# Altium project Pukk-Display-Module-v1.0.PrjPcb (part 2 of 4)

## Sheet TYPE-C_INTERFACE_SHEET.SchDoc
size A4; SheetNumber: 5; SheetTotal: 10
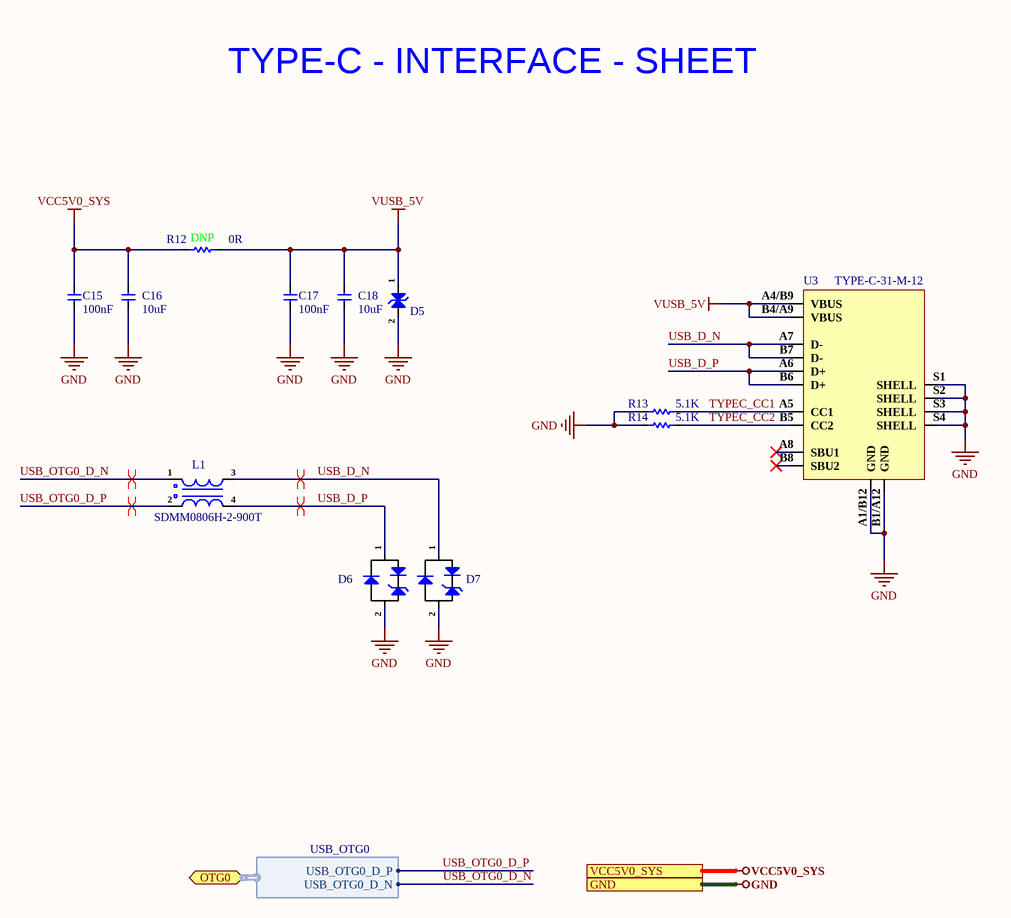
[diagram p4: TYPE-C_INTERFACE_SHEET.SchDoc]

### Parts
C15  100nF  [Cap-0402]
C16  10uF  [Cap-0402]
C17  100nF  [Cap-0402]
C18  10uF  [Cap-0402]
D5  ESD5451N  [DFN1006-2L (Bi-Directional)]  (value not drawn)
D6  ESD5341N-2/TR  [DFN1006-2L_]  (value not drawn)
D7  ESD5341N-2/TR  [DFN1006-2L_]  (value not drawn)
L1  SDMM0806H-2-900T  [0302]
R12  DNP  [Res-0805]
R13  5.1K  [Res-0402]
R14  5.1K  [Res-0402]
U3  TYPE-C-31-M-12  [TYPE-C-31-M-12_]

### Ports
GND (see CAN_SHEET[3D], GPS_INTERFACE_SHEET[3D], HDMI2.0_SHEET[3D], JOYSTICK_BUTTON_SHEET[3D], MIPI_DISPLAY-SHEET[3D], MISCELLANEOUS_SHEET[3D], POWER_SHEET[3C], radxa_CM3J_SHEET-1[4C], radxa_CM3J_SHEET-2[3D]), OTG0 (bidir, harness USB_OTG0, see radxa_CM3J_SHEET-2[1B]), VCC5V0_SYS (see CAN_SHEET[3D], HDMI2.0_SHEET[3D], MIPI_DISPLAY-SHEET[3D], POWER_SHEET[3C], radxa_CM3J_SHEET-1[4C])

### Harnesses
USB_OTG0: USB_OTG0_D_P, USB_OTG0_D_N

### Nets
GND: C15.1 C16.1 C17.1 C18.1 D5.2(K) D6.2(A) D7.2(A) R13.1 R14.1 U3.A1/B12(GND) U3.B1/A12(GND) U3.S1(SHELL) U3.S2(SHELL) U3.S3(SHELL) U3.S4(SHELL) ; port GND
VCC5V0_SYS: C15.2 C16.2 R12.1 ; port VCC5V0_SYS
VUSB_5V: C17.2 C18.2 D5.1(K) R12.2 U3.A4/B9(VBUS) U3.B4/A9(VBUS)
TYPEC_CC1: R13.2 U3.A5(CC1)
TYPEC_CC2: R14.2 U3.B5(CC2)
USB_D_N: D7.1(K) L1.3 U3.A7(D-) U3.B7(D-)
USB_D_P: D6.1(K) L1.4 U3.A6(D+) U3.B6(D+)
USB_OTG0_D_N: L1.1 ; port OTG0.USB_OTG0_D_N
USB_OTG0_D_P: L1.2 ; port OTG0.USB_OTG0_D_P

Not connected (* = marked no-connect by the designer): U3 A8(SBU1)* B8(SBU2)*

### Layout directives
differential pair; differential pair class TYPEC_DP_LINES_90: USB_D_N, USB_D_P, USB_OTG0_D_N, USB_OTG0_D_P

### Notes on the sheet
- TYPE-C - INTERFACE - SHEET
- (near R12) 0R
- File:
- Title:
- Date:
- Page
- Num:
- Total:
- Drawn By: Huzaifa Ali

### Library data of the parts
C15 C17 = CC0402KRX5R7BB104: CAP CER 0.1UF 16V X5R 0402; Manufacturer: Yageo; Tolerance: 10%; Supplier 1: Mouser; Manufacturer Part Number: CC0402KRX5R7BB104; RoHS: Yes; Category: Ceramic Capacitors; Stock 1: 936792; Pricing 1: 1=0.10000, 10=0.02300, 50=0.02300, 100=0.01100, 1000=0.00600, 10000=0.00400 (USD); Mount: Surface Mount; Case/Package: 0402; Number of Pins: 2; Case Code (Metric): 1005; Case Code (Imperial): 0402; Min Operating Temperature: -55°C; Max Operating Temperature: 85°C; Capacitance: 100nF; Dielectric: X5R; Packaging: Tape and Reel; Voltage Rating: 16V; Package Quantity: 1; Voltage Rating (DC): 16V; Termination: SMD/SMT; Resistor Type: Ceramic; Series: CC; Construction: Flat; Length: 1mm; Width: 0.02inch; Height: 0.5mm; Thickness: 0.022inch; Depth: 0.5mm; Radiation Hardening: No; REACH SVHC: Unknown; Lead Free: Lead Free; Halogen Free: Halogen Free; RoHS Compliant: Yes; ComponentLink1URL: https://datasheet.ciiva.com/155/mlccorderingcode-155879.pdf?src-supplier=Digi-Key; ComponentLink1Description: https://datasheet.ciiva.com/155/mlccorderingcode-155879.pdf?src-supplier=Digi-Key; ComponentLink2URL: https://datasheet.ciiva.com/155/mlccorderingcode-155878.pdf?src-supplier=Digi-Key; ComponentLink2Description: https://datasheet.ciiva.com/155/mlccorderingcode-155878.pdf?src-supplier=Digi-Key; ComponentLink3URL: https://datasheet.ciiva.com/155/mlccorderingcode-155880.pdf?src-supplier=Digi-Key; ComponentLink3Description: https://datasheet.ciiva.com/155/mlccorderingcode-155880.pdf?src-supplier=Digi-Key; ComponentLink4URL: https://datasheet.ciiva.com/11464/upy-gphc-x5r-4v-to-50v-12-11464869.pdf?src-supplier=Avnet; ComponentLink4Description: https://datasheet.ciiva.com/11464/upy-gphc-x5r-4v-to-50v-12-11464869.pdf?src-supplier=Avnet; Supplier Part Number 1: 603-CC402KRX5R7BB104; LCSC Part Number: C106204
C16 C18 = CC0402MRX5R6BB106: CAP CER 10UF 10V X5R 0402; Manufacturer: Yageo; Item Type: Capacitor; Tolerance: 20%; Manufacturer Part Number: CC0402MRX5R6BB106; ComponentLink1URL: http://www.yageo.com/documents/recent/UPY-GPHC_X5R_4V-to-50V_25.pdf?src-supplier=Digi-Key; ComponentLink1Description: http://www.yageo.com/documents/recent/UPY-GPHC_X5R_4V-to-50V_25.pdf?src-supplier=Digi-Key; LCSC Part Number: C962143; Supplier 1: Future Electronics; RoHS: Yes; Category: Ceramic Capacitors; Stock 1: 80000; Pricing 1: 10000=0.02650, 20000=0.02590, 30000=0.02550, 40000=0.02530, 50000=0.02450 (USD); Mount: Surface Mount; Case/Package: 0402; Case Code (Imperial): 0402; Case Code (Metric): 1005; Min Operating Temperature: -55°C; Max Operating Temperature: 85°C; Packaging: Tape and Reel; Capacitance: 10uF; Voltage Rating: 10V; RoHS Compliant: Yes; Supplier Part Number 1: 6097631
D5 = ESD5451N: DFN1006-2(0402) ESD Protection Devices ROHS; Manufacturer: TECH PUBLIC; Manufacturer Part Number: ESD5451N; Footprint: DFN1006-2(0402); ComponentLink1Description: LCSC; ComponentLink1URL: https://www.lcsc.com/product-detail/span-style-background-color-ff0-ESD-span-Protection-Devices_TECH-PUBLIC-ESD5451N_C2936977.html; LCSC Part Number: C2936977
D6 D7 = ESD5341N-2/TR: 4A@8/20us 15V 7V 5V Unidirectional DFN1006-2L TVS ROHS; Manufacturer: WILLSEMI; Item Type: Diode; Manufacturer Part Number: ESD5341N-2/TR; Package: DFN1006-2L; ComponentLink1Description: LCSC; ComponentLink1URL: https://www.lcsc.com/product-detail/TVS_WILLSEMI-Will-Semicon-ESD5341N-2-TR_C239773.html; LCSC Part Number: C239773
L1 = SDMM0806H-2-900T: 90Ω@100MHz 4Ω 2 0302 Common Mode Filters ROHS; Manufacturer: Sunlord; Manufacturer Part Number: SDMM0806H-2-900T; Package: 0302; LCSC Part Number: C370285; Item Type: Common Mode Filter; ComponentLink1Description: LCSC; ComponentLink1URL: https://www.lcsc.com/product-detail/Common-Mode-Filters_Sunlord-SDMM0806H-2-900T_C370285.html
R12 = RC0805FR-070RL: RES 0 OHM JUMPER 1/8W 0805; Manufacturer: Yageo; Resistance: 0mR; Tolerance: 1%; Power Rating: 125mW; Item Type: Resistor; Supplier 1: Avnet; Manufacturer Part Number: RC0805FR-070RL; RoHS: Yes; Category: Chip SMD Resistors; Stock 1: 85000; Pricing 1: 5000=0.00281, 10000=0.00277, 20000=0.00269 (USD); Case/Package: 0805; Contact Plating: Tin,Matte; Case Code (Imperial): 0805; Case Code (Metric): 2012; Size Code: 0805; Min Operating Temperature: -55°C; Max Operating Temperature: 155°C; Resistor Type: Thick Film; Packaging: Tape and Reel; Features: Moisture Resistant; Series: RC; Max Power Dissipation: 125mW; Number of Terminations: 2; Construction: Rectangular; Length: 2mm; Depth: 1.25mm; Radiation Hardening: No; Military Standard: Not; Lead Free: Lead Free; RoHS Compliant: Yes; ComponentLink1URL: https://datasheet.ciiva.com/15189/getdatasheetpartid-348154-15189885.pdf?src-supplier=Verical; ComponentLink1Description: https://datasheet.ciiva.com/15189/getdatasheetpartid-348154-15189885.pdf?src-supplier=Verical; ComponentLink2URL: https://datasheet.ciiva.com/17042/rc0805-17042698.pdf?src-supplier=Future+Electronics; ComponentLink2Description: https://datasheet.ciiva.com/17042/rc0805-17042698.pdf?src-supplier=Future+Electronics; Supplier Part Number 1: RC0805FR-070RL; LCSC Part Number: C100045
R13 R14 = RC0402FR-075K1L: RES 5.1K OHM 1% 1/16W 0402; Manufacturer: Yageo; Power Rating: 63mW; Resistance: 5.1kR; Temperature Coefficient: 100ppm/°C; Voltage Rating: 50V; Item Type: Resistor; Supplier 1: Avnet; Manufacturer Part Number: RC0402FR-075K1L; RoHS: Yes; Category: Chip SMD Resistors; Stock 1: 65000; Pricing 1: 10000=0.00085 (USD); Case/Package: 0402; Case Code (Metric): 1005; Case Code (Imperial): 0402; Min Operating Temperature: -55°C; Max Operating Temperature: 155°C; Tolerance: 1%; Technology: THICK FILM; Packaging: Tape and Reel; Package Quantity: 1; Resistor Type: Thick Film; Number of Terminations: 2; Termination: SMD/SMT; Max Power Dissipation: 63mW; Voltage Rating (DC): 50V; Working Voltage: 50V; Features: Moisture Resistant; Series: RC; Resistance Tolerance: 1%; Construction: Rectangular; Length: 1mm; Width: 0.02inch; Height: 0.016inch; Depth: 0.5mm; RoHS Compliant: Yes; Military Standard: Not; Lead Free: Lead Free; ComponentLink1URL: https://datasheet.ciiva.com/7983/1018594-7983519.pdf?src-supplier=Element14; ComponentLink1Description: https://datasheet.ciiva.com/7983/1018594-7983519.pdf?src-supplier=Element14; ComponentLink2URL: https://datasheet.ciiva.com/46394/1018594-46394936.pdf?src-supplier=Element14; ComponentLink2Description: https://datasheet.ciiva.com/46394/1018594-46394936.pdf?src-supplier=Element14; ComponentLink3URL: https://datasheet.ciiva.com/2453/pyu-r-int-thick-7-2453401.pdf?src-supplier=Digi-Key; ComponentLink3Description: https://datasheet.ciiva.com/2453/pyu-r-int-thick-7-2453401.pdf?src-supplier=Digi-Key; ComponentLink4URL: https://datasheet.ciiva.com/2453/pyu-r-int-thick-7-2453402.pdf?src-supplier=Digi-Key; ComponentLink4Description: https://datasheet.ciiva.com/2453/pyu-r-int-thick-7-2453402.pdf?src-supplier=Digi-Key; ComponentLink5URL: https://datasheet.ciiva.com/2453/pyu-r-int-thick-7-2453400.pdf?src-supplier=Digi-Key; ComponentLink5Description: https://datasheet.ciiva.com/2453/pyu-r-int-thick-7-2453400.pdf?src-supplier=Digi-Key; ComponentLink6URL: https://datasheet.ciiva.com/12558/pyu-rc0402-51-rohs-l-6-r-8721-12558460.pdf?src-supplier=Mouser; ComponentLink6Description: https://datasheet.ciiva.com/12558/pyu-rc0402-51-rohs-l-6-r-8721-12558460.pdf?src-supplier=Mouser; ComponentLink7URL: https://datasheet.ciiva.com/16744/pyu-rc0402-51-rohs-l-6-r-16744283.pdf?src-supplier=Future+Electronics; ComponentLink7Description: https://datasheet.ciiva.com/16744/pyu-rc0402-51-rohs-l-6-r-16744283.pdf?src-supplier=Future+Electronics; ComponentLink8URL: https://datasheet.ciiva.com/15189/getdatasheetpartid-323636-15189493.pdf?src-supplier=Verical; ComponentLink8Description: https://datasheet.ciiva.com/15189/getdatasheetpartid-323636-15189493.pdf?src-supplier=Verical; Supplier Part Number 1: RC0402FR-075K1L; LCSC Part Number: C105872
U3 = TYPE-C-31-M-12: 5A 1 16P Female Type-C SMD USB Connectors ROHS; Manufacturer: Korean Hroparts Elec; ComponentLink1Description: LCSC; ComponentLink1URL: https://www.lcsc.com/product-detail/USB-Connectors_Korean-Hroparts-Elec-TYPE-C-31-M-12_C165948.html; Manufacturer Part Number: TYPE-C-31-M-12; Footprint: Custom; LCSC Part Number: C165948; Item Type: USB Connector

## Sheet MIPI_DISPLAY-SHEET.SchDoc
size A4; SheetNumber: 6; SheetTotal: 10
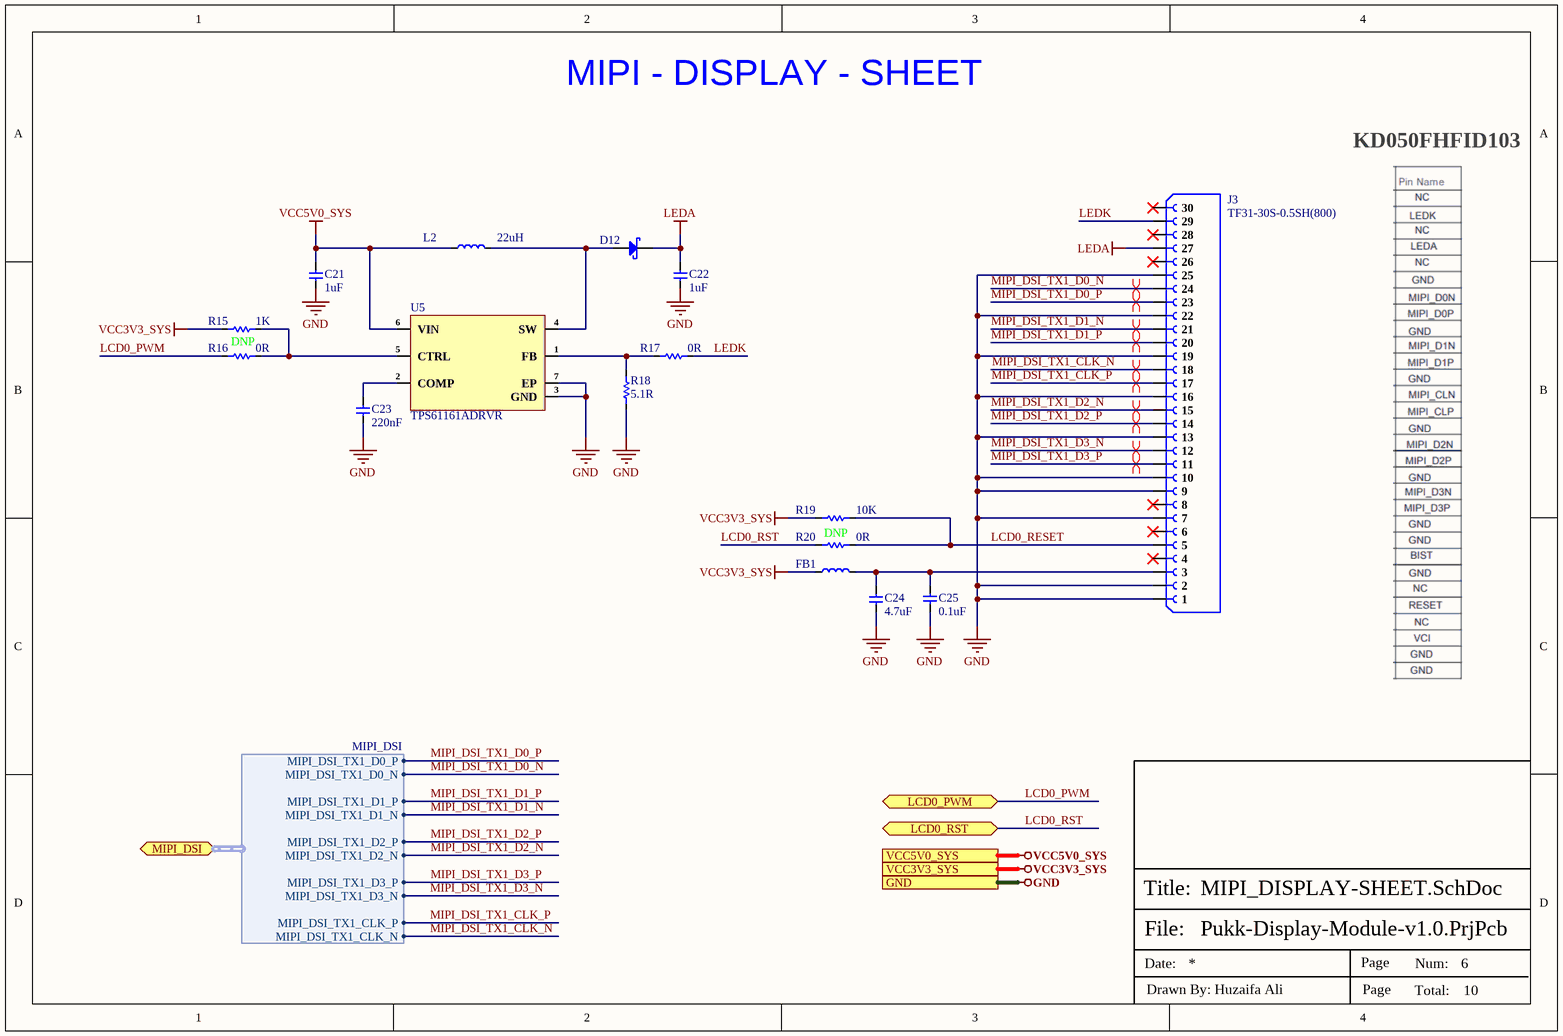
[diagram p5: MIPI_DISPLAY-SHEET.SchDoc]

### Parts
C21  1uF  [Cap-0603]
C22  1uF  [Cap-0603]
C23  220nF  [Cap-0402]
C24  4.7uF  [Cap-0402]
C25  0.1uF  [Cap-0402]
D12  SS16  [SMA]  (value not drawn)
FB1  BLM18PG181SN1D  [IND-0603 (1608 Metric)]  (value not drawn)
J3  TF31-30S-0.5SH(800)  [TF31-30S-0.5SH(800)]
L2  22uH  [VLCF5020T-220MR75-1]
R15  1K  [Res-0402]
R16  DNP  [Res-0402]
R17  0R  [Res-0402]
R18  5.1R  [RES-0805]
R19  10K  [Res-0402]
R20  DNP  [Res-0402]
U5  TPS61161ADRVR  [WSON-6-EP(2x2)]

### Ports
GND (see CAN_SHEET[3D], GPS_INTERFACE_SHEET[3D], HDMI2.0_SHEET[3D], JOYSTICK_BUTTON_SHEET[3D], MISCELLANEOUS_SHEET[3D], POWER_SHEET[3C], radxa_CM3J_SHEET-1[4C], radxa_CM3J_SHEET-2[3D], TYPE-C_INTERFACE_SHEET[3D]), LCD0_PWM (bidir, see radxa_CM3J_SHEET-1[4C]), LCD0_RST (bidir, see radxa_CM3J_SHEET-1[4C]), MIPI_DSI (bidir, harness MIPI_DSI, see radxa_CM3J_SHEET-2[1D]), VCC3V3_SYS (see GPS_INTERFACE_SHEET[3D], HDMI2.0_SHEET[3D], MISCELLANEOUS_SHEET[3D], POWER_SHEET[3C]), VCC5V0_SYS (see CAN_SHEET[3D], HDMI2.0_SHEET[3D], POWER_SHEET[3C], radxa_CM3J_SHEET-1[4C], TYPE-C_INTERFACE_SHEET[3D])

### Harnesses
MIPI_DSI: MIPI_DSI_TX1_D0_P, MIPI_DSI_TX1_D0_N, MIPI_DSI_TX1_D1_P, MIPI_DSI_TX1_D1_N, MIPI_DSI_TX1_D2_P, MIPI_DSI_TX1_D2_N, MIPI_DSI_TX1_D3_P, MIPI_DSI_TX1_D3_N, MIPI_DSI_TX1_CLK_P, MIPI_DSI_TX1_CLK_N

### Nets
GND: C21.1 C22.1 C23.1 C24.1 C25.2 J3.1 J3.2 J3.7 J3.9 J3.10 J3.13 J3.16 J3.19 J3.22 J3.25 R18.1 U5.3(GND) U5.7(EP) ; port GND
LEDA: C22.2 D12.1(K) J3.27
VCC3V3_SYS: FB1.1 R15.2 R19.2 ; port VCC3V3_SYS
VCC5V0_SYS: C21.2 L2.1 U5.6(VIN) ; port VCC5V0_SYS
LCD0_PWM: R16.1 ; port LCD0_PWM
LCD0_RESET: J3.5 R19.1 R20.2
LCD0_RST: R20.1 ; port LCD0_RST
LEDK: J3.29 R17.2
MIPI_DSI_TX1_CLK_N: J3.18 ; port MIPI_DSI.MIPI_DSI_TX1_CLK_N
MIPI_DSI_TX1_CLK_P: J3.17 ; port MIPI_DSI.MIPI_DSI_TX1_CLK_P
MIPI_DSI_TX1_D0_N: J3.24 ; port MIPI_DSI.MIPI_DSI_TX1_D0_N
MIPI_DSI_TX1_D0_P: J3.23 ; port MIPI_DSI.MIPI_DSI_TX1_D0_P
MIPI_DSI_TX1_D1_N: J3.21 ; port MIPI_DSI.MIPI_DSI_TX1_D1_N
MIPI_DSI_TX1_D1_P: J3.20 ; port MIPI_DSI.MIPI_DSI_TX1_D1_P
MIPI_DSI_TX1_D2_N: J3.15 ; port MIPI_DSI.MIPI_DSI_TX1_D2_N
MIPI_DSI_TX1_D2_P: J3.14 ; port MIPI_DSI.MIPI_DSI_TX1_D2_P
MIPI_DSI_TX1_D3_N: J3.12 ; port MIPI_DSI.MIPI_DSI_TX1_D3_N
MIPI_DSI_TX1_D3_P: J3.11 ; port MIPI_DSI.MIPI_DSI_TX1_D3_P
NetC23_2: C23.2 U5.2(COMP)
NetC24_2: C24.2 C25.1 FB1.2 J3.3
NetD12_2: D12.2(A) L2.2 U5.4(SW)
NetR15_1: R15.1 R16.2 U5.5(CTRL)
NetR17_1: R17.1 R18.2 U5.1(FB)

Not connected (* = marked no-connect by the designer): J3 4* 6* 8* 26* 28* 30*

### Layout directives
differential pair; differential pair class MIPI; rule Impedance Constraint [Min = 97.00    Max = 103.0    ]: MIPI_DSI_TX1_CLK_N, MIPI_DSI_TX1_CLK_P, MIPI_DSI_TX1_D0_N, MIPI_DSI_TX1_D0_P, MIPI_DSI_TX1_D1_N, MIPI_DSI_TX1_D1_P, MIPI_DSI_TX1_D2_N, MIPI_DSI_TX1_D2_P, MIPI_DSI_TX1_D3_N, MIPI_DSI_TX1_D3_P

### Notes on the sheet
- MIPI - DISPLAY - SHEET
- KD050FHFID103
- (near R16) 0R
- (near R20) 0R
- File:
- Title:
- Date:
- Page
- Num:
- Total:
- Drawn By: Huzaifa Ali

### Library data of the parts
C21 C22 = CL10A105KB8NNNC: CAP CER 1UF 50V X5R 0603; Manufacturer: Samsung; Material: 4241ConductorMaterial; Tolerance: 10%; Item Type: Capacitor; Supplier: Avnet; Supplier Part Number: CL10A105KB8NNNC; Manufacturer Part Number: CL10A105KB8NNNC; RoHS: Yes; Category: Ceramic Capacitors; Stock: 780446; Pricing: 4000=0.01632, 8000=0.01595, 16000=0.01557, 24000=0.0152, 32000=0.01482 (USD); Mounting Technology: Surface Mount; Case/Package: 0603; Case Code (Metric): 1608; Case Code (Imperial): 0603; Min Operating Temperature: -55°C; Max Operating Temperature: 85°C; Packaging: Tape and Reel; Value: 1uF; Voltage Rating: 50V; Dielectric: X5R; Series: CL; Voltage Rating (DC): 50V; Length: 1.6mm; Depth: 0.8mm; Radiation Hardening: No; RoHS Compliant: Yes; ComponentLink1URL: https://datasheet.ciiva.com/26877/getdatasheetpartid-753736-26877879.pdf?src-supplier=Verical; ComponentLink1Description: https://datasheet.ciiva.com/26877/getdatasheetpartid-753736-26877879.pdf?src-supplier=Verical; LCSC Part Number: C15849
C23 = CC0402KRX5R8BB224: CAP CER 0.22UF 25V X5R 0402; Manufacturer: Yageo; Item Type: Capacitors; Tolerance: 10%; Supplier 1: Mouser; Manufacturer Part Number: CC0402KRX5R8BB224; RoHS: Yes; Stock 1: 61266; Pricing 1: 1=0.10000, 10=0.03300, 50=0.03300, 100=0.02700, 1000=0.01500, 10000=0.01300 (USD); Mount: Surface Mount; Case/Package: 0402; Min Operating Temperature: -55°C; Max Operating Temperature: 85°C; Packaging: Tape and Reel; Capacitance: 220nF; Voltage Rating: 25V; Voltage Rating (DC): 25V; Dielectric: X5R; Length: 0.039inch; Width: 0.02inch; Thickness: 0.022inch; Lead Free: Lead Free; Halogen Free: Halogen Free; RoHS Compliant: Yes; ComponentLink1URL: http://www.yageo.com/documents/recent/UPY-GPHC_X5R_4V-to-50V_25.pdf?src-supplier=Digi-Key; ComponentLink1Description: http://www.yageo.com/documents/recent/UPY-GPHC_X5R_4V-to-50V_25.pdf?src-supplier=Digi-Key; ComponentLink2URL: https://www.yageo.com/upload/media/product/productsearch/datasheet/mlcc/UPY-GPHC_X5R_4V-to-50V_26.pdf?src-supplier=Digi-Key; ComponentLink2Description: https://www.yageo.com/upload/media/product/productsearch/datasheet/mlcc/UPY-GPHC_X5R_4V-to-50V_26.pdf?src-supplier=Digi-Key; ComponentLink3URL: http://www.yageo.com/documents/recent/UPY-GPHC_X5R_4V-to-50V_23.pdf?src-supplier=Digi-Key; ComponentLink3Description: http://www.yageo.com/documents/recent/UPY-GPHC_X5R_4V-to-50V_23.pdf?src-supplier=Digi-Key; Supplier Part Number 1: 603-CC402KRX5R8BB224; LCSC Part Number: C326836
C24 = CC0402KRX5R6BB475: CAP CER 4.7UF 10V X5R 0402; Manufacturer: Yageo; Tolerance: 10%; Supplier 1: Farnell; Manufacturer Part Number: CC0402KRX5R6BB475; RoHS: Yes; Category: Ceramic Capacitors; Stock 1: 20000; Pricing 1: 10000=0.02310, 50000=0.02100 (GBP); Mount: Surface Mount; Case/Package: 0402; Case Code (Imperial): 0402; Case Code (Metric): 1005; Min Operating Temperature: -55°C; Max Operating Temperature: 85°C; Packaging: Cut Tape; Capacitance: 4.7uF; Voltage Rating: 10V; RoHS Compliant: Yes; ComponentLink1URL: http://www.yageo.com/documents/recent/UPY-GPHC_X5R_4V-to-50V_25.pdf?src-supplier=Digi-Key; ComponentLink1Description: http://www.yageo.com/documents/recent/UPY-GPHC_X5R_4V-to-50V_25.pdf?src-supplier=Digi-Key; Supplier Part Number 1: 3871698; LCSC Part Number: C326586
C25 = GRM155R71H104ME14D: CAP CER 0.1UF 50V X7R 0402; Manufacturer: Murata; Tolerance: 20%; Capacitance: 100nF; Item Type: Capacitor; Supplier 1: Avnet; Manufacturer Part Number: GRM155R71H104ME14D; RoHS: Yes; Category: Ceramic Capacitors; Stock 1: 100000; Pricing 1: 10000=0.00444, 20000=0.00420, 40000=0.00396, 60000=0.00372, 80000=0.00348, 100000=0.00324, 1000000=0.00300 (USD); Mount: Surface Mount; Case/Package: 0402; Min Operating Temperature: -55°C; Max Operating Temperature: 125°C; Packaging: Cut Tape; Voltage Rating: 50V; Length: 0.039inch; Width: 0.02inch; Thickness: 0.022inch; RoHS Compliant: Yes; ComponentLink1URL: http://www.mouser.com/ds/2/281/c02e-2905.pdf?src-supplier=Mouser; ComponentLink1Description: http://www.mouser.com/ds/2/281/c02e-2905.pdf?src-supplier=Mouser; ComponentLink2URL: http://search.murata.co.jp/Ceramy/image/img/A01X/G101/ENG/GRM155R71H104ME14-01.pdf?src-supplier=Digi-Key; ComponentLink2Description: http://search.murata.co.jp/Ceramy/image/img/A01X/G101/ENG/GRM155R71H104ME14-01.pdf?src-supplier=Digi-Key; ComponentLink3URL: http://psearch.en.murata.com/capacitor/product/GRM155R71H104ME14%23.pdf?src-supplier=Avnet; ComponentLink3Description: http://psearch.en.murata.com/capacitor/product/GRM155R71H104ME14%23.pdf?src-supplier=Avnet; Supplier Part Number 1: GRM155R71H104ME14D; LCSC Part Number: C182412
D12 = SS16: 60V 700mV@1A 1A SMA(DO-214AC) Schottky Barrier Diodes (SBD) ROHS; Manufacturer: MDD; Item Type: Schottky Diode; Manufacturer Part Number: SS16; Package: SMA(DO-214AC); LCSC Part Number: C2481; ComponentLink1Description: LCSC; ComponentLink1URL: https://www.lcsc.com/product-detail/Schottky-Barrier-Diodes-SBD_MDD-Microdiode-Electronics-SS16_C2481.html
FB1 = BLM18PG181SN1D: 0603 180Ω ±25% DCR=0.09Ω 1.5A; Manufacturer: Murata; Manufacturer Series: BLM18P; Core Material: Ferrite; Material: Ferrite,Steel; Impedance: 180R; Number of Lines: 1; DC Resistance (DCR): 90mR; Test Frequency: 100MHz; Shielding: Unshielded; Item Type: Ferrite Bead; Supplier 1: Arrow Electronics; Manufacturer Part Number: BLM18PG181SN1D; RoHS: Yes; Category: Inductors; Stock 1: 13; Pricing 1: 1=0.08740, 10=0.06280 (USD); Case/Package: 0603; Number of Pins: 2; Case Code (Metric): 1608; Case Code (Imperial): 0603; Terminal Finish: Tin; Min Operating Temperature: -55°C; Max Operating Temperature: 125°C; Package Quantity: 1; Tolerance: 25%; Packaging: Tape and Reel; Current Rating: 1.5A; Max Current Rating: 1.5A; Max DC Current: 1.5A; Termination: SMD/SMT; DC Current: 1.5A; Number of Circuits: 1; Series: BLM18P; Number of Functions: 1; DC Resistance-Max: 90mR; Length: 1.6mm; Width: 0.8mm; Height: 0.8mm; Depth: 0.8mm; Radiation Hardening: No; REACH SVHC: No SVHC; Lead Free: Lead Free; RoHS Compliant: Yes; ComponentLink1URL: https://datasheet.ciiva.com/36526/1845021-36526048.pdf?src-supplier=Jameco; ComponentLink1Description: https://datasheet.ciiva.com/36526/1845021-36526048.pdf?src-supplier=Jameco; ComponentLink2URL: https://datasheet.ciiva.com/11800/0900766b81275ca5-11800854.pdf?src-supplier=RSComponents; ComponentLink2Description: https://datasheet.ciiva.com/11800/0900766b81275ca5-11800854.pdf?src-supplier=RSComponents; ComponentLink3URL: https://datasheet.ciiva.com/29347/442378-da-01-en-chip-drossel-0603-180r-1500ma-1-6x0-8mm-29347913.pdf?src-supplier=Conrad; ComponentLink3Description: https://datasheet.ciiva.com/29347/442378-da-01-en-chip-drossel-0603-180r-1500ma-1-6x0-8mm-29347913.pdf?src-supplier=Conrad; ComponentLink4URL: https://datasheet.ciiva.com/8021/5148-8021478.pdf?src-supplier=Element14; ComponentLink4Description: https://datasheet.ciiva.com/8021/5148-8021478.pdf?src-supplier=Element14; ComponentLink5URL: https://datasheet.ciiva.com/8021/5148-8021496.pdf?src-supplier=Element14; ComponentLink5Description: https://datasheet.ciiva.com/8021/5148-8021496.pdf?src-supplier=Element14; ComponentLink6URL: https://datasheet.ciiva.com/1012/l0110s0100blm18p-1012153.pdf?src-supplier=Digi-Key; ComponentLink6Description: https://datasheet.ciiva.com/1012/l0110s0100blm18p-1012153.pdf?src-supplier=Digi-Key; ComponentLink7URL: https://datasheet.ciiva.com/1012/l0110s0100blm18p-1012152.pdf?src-supplier=Digi-Key; ComponentLink7Description: https://datasheet.ciiva.com/1012/l0110s0100blm18p-1012152.pdf?src-supplier=Digi-Key; ComponentLink8URL: https://datasheet.ciiva.com/1012/l0110s0100blm18p-1012154.pdf?src-supplier=Digi-Key; ComponentLink8Description: https://datasheet.ciiva.com/1012/l0110s0100blm18p-1012154.pdf?src-supplier=Digi-Key; ComponentLink9URL: https://datasheet.ciiva.com/8084/l0110s0100blm18p-8084296.pdf?src-supplier=Avnet; ComponentLink9Description: https://datasheet.ciiva.com/8084/l0110s0100blm18p-8084296.pdf?src-supplier=Avnet; ComponentLink10URL: https://datasheet.ciiva.com/16394/l0110s0100blm18p-16394029.pdf?src-supplier=Future+Electronics; ComponentLink10Description: https://datasheet.ciiva.com/16394/l0110s0100blm18p-16394029.pdf?src-supplier=Future+Electronics; Supplier Part Number 1: BLM18PG181SN1D; LCSC Part Number: C82850
J3 = TF31-30S-0.5SH(800): CONN FFC BOTTOM 30POS 0.5MM R/A; Manufacturer: Hirose; Item Type: FFC / FPC Connector; Supplier: Digikey; Supplier Part Number: 26-TF31-30S-0.5SH(800)CT-ND; Manufacturer Part Number: TF31-30S-0.5SH(800); RoHS: Yes; Stock: 14095; Pricing: 1=2.37, 10=2.065, 25=1.9772, 50=1.9332, 100=1.8453, 250=1.66952, 500=1.53772, 1000=1.31805 (USD); ComponentLink1URL: https://www.hirose.com/product/download/?distributor=digikey&amp;type=specSheet&amp;lang=en&amp;num=TF31-30S-0.5SH(800)&src-supplier=Digikey; ComponentLink1Description: https://www.hirose.com/product/download/?distributor=digikey&amp;type=specSheet&amp;lang=en&amp;num=TF31-30S-0.5SH(800)&src-supplier=Digikey; ComponentLink2URL: https://datasheet.octopart.com/TF31-30S-0.5SH%28800%29-Hirose-datasheet-138123803.pdf?src-supplier=Sager+Electronics; ComponentLink2Description: https://datasheet.octopart.com/TF31-30S-0.5SH%28800%29-Hirose-datasheet-138123803.pdf?src-supplier=Sager+Electronics; LCSC Part Number: C5137133
L2 = VLCF5020T-220MR75-1: FIXED IND 22UH 750MA 496MOHM SMD; Manufacturer: TDK; Item Type: Inductors; Supplier: Avnet; LCSC Part Number: C87576; Manufacturer Part Number: VLCF5020T-220MR75-1; RoHS: Yes; Stock: 1000; Pricing: 500=0.2562 (USD); ComponentLink1URL: https://datasheet.ciiva.com/11800/0900766b807a173e-11800091.pdf?src-supplier=Rs; ComponentLink1Description: https://datasheet.ciiva.com/11800/0900766b807a173e-11800091.pdf?src-supplier=Rs; ComponentLink2URL: https://datasheet.ciiva.com/4956/e531-vlcf-18500-4956649.pdf?src-supplier=Mouser; ComponentLink2Description: https://datasheet.ciiva.com/4956/e531-vlcf-18500-4956649.pdf?src-supplier=Mouser; ComponentLink3URL: https://datasheet.ciiva.com/8045/516785-8045801.pdf?src-supplier=Element14; ComponentLink3Description: https://datasheet.ciiva.com/8045/516785-8045801.pdf?src-supplier=Element14; ComponentLink4URL: https://datasheet.ciiva.com/22725/516785-22725947.pdf?src-supplier=Element14; ComponentLink4Description: https://datasheet.ciiva.com/22725/516785-22725947.pdf?src-supplier=Element14
R15 = RC0402FR-071KL: RES 1K OHM 1% 1/16W 0402; Manufacturer: Yageo; Resistance: 1kR; Temperature Coefficient: 100ppm/°C; Voltage Rating (DC): 50V; Power Rating: 62.5mW; Max Power Dissipation: 63mW; Item Type: Resistor; Supplier 1: Avnet; Manufacturer Part Number: RC0402FR-071KL; RoHS: Yes; Category: Chip SMD Resistors; Stock 1: 13030000; Pricing 1: 10000=0.00085, 20000=0.00087, 40000=0.00084, 60000=0.00083, 80000=0.00079, 100000=0.00078, 1000000=0.00076 (USD); Case/Package: 0402; Number of Pins: 2; Case Code (Imperial): 0402; Case Code (Metric): 1005; Size Code: 0402; Min Operating Temperature: -55°C; Max Operating Temperature: 155°C; Resistor Type: Thick Film; Tolerance: 1%; Packaging: Tape and Reel; Voltage Rating: 50V; Termination: SMD/SMT; Features: Moisture Resistant; Series: RC; Number of Terminations: 2; Resistance Tolerance: 1%; Construction: Rectangular; Technology: THICK FILM; Length: 1mm; Width: 0.5mm; Height: 0.32mm; Depth: 0.5mm; Reach SVHC Compliant: Yes; Lead Free: Lead Free; RoHS Compliant: Yes; Military Standard: Not; ComponentLink1URL: https://datasheet.ciiva.com/11819/0900766b80c66297-11819477.pdf?src-supplier=RSComponents; ComponentLink1Description: https://datasheet.ciiva.com/11819/0900766b80c66297-11819477.pdf?src-supplier=RSComponents; ComponentLink2URL: https://datasheet.ciiva.com/7983/1018594-7983502.pdf?src-supplier=Element14; ComponentLink2Description: https://datasheet.ciiva.com/7983/1018594-7983502.pdf?src-supplier=Element14; ComponentLink3URL: https://datasheet.ciiva.com/22747/1018594-22747513.pdf?src-supplier=Element14; ComponentLink3Description: https://datasheet.ciiva.com/22747/1018594-22747513.pdf?src-supplier=Element14; ComponentLink4URL: https://datasheet.ciiva.com/12666/pyu-rc0402-51-rohs-l-6-r-12666741.pdf?src-supplier=Mouser; ComponentLink4Description: https://datasheet.ciiva.com/12666/pyu-rc0402-51-rohs-l-6-r-12666741.pdf?src-supplier=Mouser; ComponentLink5URL: https://datasheet.ciiva.com/7849/1018594-7849869.pdf?src-supplier=Element14; ComponentLink5Description: https://datasheet.ciiva.com/7849/1018594-7849869.pdf?src-supplier=Element14; ComponentLink6URL: https://datasheet.ciiva.com/7849/1018594-7849871.pdf?src-supplier=Element14; ComponentLink6Description: https://datasheet.ciiva.com/7849/1018594-7849871.pdf?src-supplier=Element14; ComponentLink7URL: https://datasheet.ciiva.com/17063/pyu-rc0402-51-rohs-l-6-r-17063193.pdf?src-supplier=Future+Electronics; ComponentLink7Description: https://datasheet.ciiva.com/17063/pyu-rc0402-51-rohs-l-6-r-17063193.pdf?src-supplier=Future+Electronics; Supplier Part Number 1: RC0402FR-071KL; LCSC Part Number: C106235
R16 R20 = RC0402FR-070RL: RES 0 OHM JUMPER 1/16W 0402; Manufacturer: Yageo; Item Type: Resistors; Resistance: 0R; Tolerance: 1%; Power Rating: 62.5mW; Voltage Rating: 50V; Temperature Coefficient: 200ppm/°C; Max Power Dissipation: 63mW; Supplier 1: Mouser; Manufacturer Part Number: RC0402FR-070RL; RoHS: Yes; Stock 1: 8556842; Pricing 1: 1=0.10000, 10=0.01400, 50=0.01400, 100=0.00600, 1000=0.00300, 5000=0.00200, 10000=0.00100 (USD); Mount: Surface Mount; Case/Package: 0402; Contact Plating: Tin,Matte; Case Code (Imperial): 0402; Case Code (Metric): 1005; Size Code: 0402; Min Operating Temperature: -55°C; Max Operating Temperature: 155°C; Resistor Type: Thick Film; Packaging: Tape and Reel; Termination: SMD/SMT; Features: Moisture Resistant; Series: RC; Number of Terminations: 2; Length: 1mm; Width: 0.5mm; Height: 0.35mm; Radiation Hardening: No; Lead Free: Lead Free; RoHS Compliant: Yes; ComponentLink1URL: https://datasheet.ciiva.com/8896/pyu-rc0402-51-rohs-l-6-8896149.pdf?src-supplier=Avnet; ComponentLink1Description: https://datasheet.ciiva.com/8896/pyu-rc0402-51-rohs-l-6-8896149.pdf?src-supplier=Avnet; ComponentLink2URL: https://datasheet.ciiva.com/16790/pyu-rc0402-51-rohs-l-6-r-16790444.pdf?src-supplier=Future+Electronics; ComponentLink2Description: https://datasheet.ciiva.com/16790/pyu-rc0402-51-rohs-l-6-r-16790444.pdf?src-supplier=Future+Electronics; Supplier Part Number 1: 603-RC0402FR-070RL; LCSC Part Number: C106231
R17 = RC0402FR-070RL: RES 0 OHM JUMPER 1/16W 0402; Manufacturer: Yageo; Item Type: Resistors; Tolerance: 1%; Power Rating: 62.5mW; Voltage Rating: 50V; Temperature Coefficient: 200ppm/°C; Max Power Dissipation: 63mW; Supplier 1: Mouser; Manufacturer Part Number: RC0402FR-070RL; RoHS: Yes; Stock 1: 8556842; Pricing 1: 1=0.10000, 10=0.01400, 50=0.01400, 100=0.00600, 1000=0.00300, 5000=0.00200, 10000=0.00100 (USD); Mount: Surface Mount; Case/Package: 0402; Contact Plating: Tin,Matte; Case Code (Imperial): 0402; Case Code (Metric): 1005; Size Code: 0402; Min Operating Temperature: -55°C; Max Operating Temperature: 155°C; Resistance: 0R; Resistor Type: Thick Film; Packaging: Tape and Reel; Termination: SMD/SMT; Features: Moisture Resistant; Series: RC; Number of Terminations: 2; Length: 1mm; Width: 0.5mm; Height: 0.35mm; Radiation Hardening: No; Lead Free: Lead Free; RoHS Compliant: Yes; ComponentLink1URL: https://datasheet.ciiva.com/8896/pyu-rc0402-51-rohs-l-6-8896149.pdf?src-supplier=Avnet; ComponentLink1Description: https://datasheet.ciiva.com/8896/pyu-rc0402-51-rohs-l-6-8896149.pdf?src-supplier=Avnet; ComponentLink2URL: https://datasheet.ciiva.com/16790/pyu-rc0402-51-rohs-l-6-r-16790444.pdf?src-supplier=Future+Electronics; ComponentLink2Description: https://datasheet.ciiva.com/16790/pyu-rc0402-51-rohs-l-6-r-16790444.pdf?src-supplier=Future+Electronics; Supplier Part Number 1: 603-RC0402FR-070RL; LCSC Part Number: C106231
R18 = RC0805JR-075R1L: RES 5.1 OHM 5% 1/8W 0805; Manufacturer: Yageo; Item Type: Resistor; Supplier: Future Electronics; Supplier Part Number: 9870346; Manufacturer Part Number: RC0805JR-075R1L; RoHS: Yes; Category: Chip SMD Resistors; Stock: 15000; Pricing: 5000=0.0054, 20000=0.0051, 75000=0.0048, 200000=0.0046, 500000=0.0043 (USD); ComponentLink1URL: https://datasheet.ciiva.com/2456/pyu-r-int-thick-7-2456339.pdf?src-supplier=Digikey; ComponentLink1Description: https://datasheet.ciiva.com/2456/pyu-r-int-thick-7-2456339.pdf?src-supplier=Digikey; ComponentLink2URL: https://datasheet.ciiva.com/2456/pyu-r-int-thick-7-2456340.pdf?src-supplier=Digikey; ComponentLink2Description: https://datasheet.ciiva.com/2456/pyu-r-int-thick-7-2456340.pdf?src-supplier=Digikey; ComponentLink3URL: https://datasheet.ciiva.com/2456/pyu-r-int-thick-7-2456341.pdf?src-supplier=Digikey; ComponentLink3Description: https://datasheet.ciiva.com/2456/pyu-r-int-thick-7-2456341.pdf?src-supplier=Digikey; ComponentLink4URL: https://datasheet.ciiva.com/17045/rc0805-17045032.pdf?src-supplier=Future+Electronics; ComponentLink4Description: https://datasheet.ciiva.com/17045/rc0805-17045032.pdf?src-supplier=Future+Electronics; ComponentLink5URL: https://datasheet.ciiva.com/5595/rc0805-5595916.pdf?src-supplier=Mouser; ComponentLink5Description: https://datasheet.ciiva.com/5595/rc0805-5595916.pdf?src-supplier=Mouser
R19 = RC0402FR-0710KL: RES 10K OHM 1% 1/16W 0402; Manufacturer: Yageo; Resistance: 10kR; Voltage Rating (DC): 50V; Temperature Coefficient: 100ppm/°C; Power Rating: 62.5mW; Max Power Dissipation: 63mW; Item Type: Resistor; Supplier 1: Mouser; Manufacturer Part Number: RC0402FR-0710KL; RoHS: Yes; Category: Chip SMD Resistors; Stock 1: 18648329; Pricing 1: 1=0.10000, 10=0.01400, 50=0.01400, 100=0.00500, 1000=0.00300, 10000=0.00200 (USD); Case/Package: 0402; Number of Pins: 2; Case Code (Imperial): 0402; Case Code (Metric): 1005; Min Operating Temperature: -55°C; Max Operating Temperature: 155°C; Resistor Type: Thick Film; Tolerance: 1%; Packaging: Tape and Reel; Voltage Rating: 50V; Termination: SMD/SMT; Working Voltage: 50V; Number of Terminations: 2; Features: Moisture Resistant; Series: RC; Resistance Tolerance: 1%; Construction: Rectangular; Length: 1mm; Width: 0.5mm; Height: 0.32mm; Depth: 0.5mm; Lead Pitch: 0.2mm; REACH SVHC: No SVHC; Lead Free: Lead Free; RoHS Compliant: Yes; Military Standard: Not; ComponentLink1URL: https://datasheet.ciiva.com/7660/38568-7660787.pdf?src-supplier=Element14; ComponentLink1Description: https://datasheet.ciiva.com/7660/38568-7660787.pdf?src-supplier=Element14; ComponentLink2URL: https://datasheet.ciiva.com/7849/1686128-7849814.pdf?src-supplier=Element14; ComponentLink2Description: https://datasheet.ciiva.com/7849/1686128-7849814.pdf?src-supplier=Element14; ComponentLink3URL: https://datasheet.ciiva.com/7983/1018594-7983486.pdf?src-supplier=Element14; ComponentLink3Description: https://datasheet.ciiva.com/7983/1018594-7983486.pdf?src-supplier=Element14; ComponentLink4URL: https://datasheet.ciiva.com/22747/1018594-22747512.pdf?src-supplier=Element14; ComponentLink4Description: https://datasheet.ciiva.com/22747/1018594-22747512.pdf?src-supplier=Element14; ComponentLink5URL: https://datasheet.ciiva.com/12667/pyu-rc0402-51-rohs-l-6-r-12667067.pdf?src-supplier=Mouser; ComponentLink5Description: https://datasheet.ciiva.com/12667/pyu-rc0402-51-rohs-l-6-r-12667067.pdf?src-supplier=Mouser; ComponentLink6URL: https://datasheet.ciiva.com/7849/1784430-7849813.pdf?src-supplier=Element14; ComponentLink6Description: https://datasheet.ciiva.com/7849/1784430-7849813.pdf?src-supplier=Element14; ComponentLink7URL: https://datasheet.ciiva.com/7849/1784430-7849815.pdf?src-supplier=Element14; ComponentLink7Description: https://datasheet.ciiva.com/7849/1784430-7849815.pdf?src-supplier=Element14; Supplier Part Number 1: 603-RC0402FR-0710KL; LCSC Part Number: C60490
U5 = TPS61161ADRVR: IC LED DRV RGLTR PWM 700MA 6WSON; Manufacturer: Texas Instruments; Supplier: Mouser; Supplier Part Number: 595-TPS61161ADRVR; Manufacturer Part Number: TPS61161ADRVR; RoHS: Yes; Category: LED Drivers; Stock: 3931; Pricing: 1=1.35, 10=0.864, 50=0.864, 100=0.696, 1000=0.618, 10000=0.53 (USD); Length: 2mm; Width: 2mm; Height: 800um; Thickness: 750um; Lead Free: 5697LeadFree; ComponentLink1URL: https://datasheet.ciiva.com/15135/getdatasheetpartid-621302-15135612.pdf?src-supplier=Verical; ComponentLink1Description: https://datasheet.ciiva.com/15135/getdatasheetpartid-621302-15135612.pdf?src-supplier=Verical; ComponentLink2URL: https://datasheet.ciiva.com/12277/slvs937a-120933-12277974.pdf?src-supplier=Mouser; ComponentLink2Description: https://datasheet.ciiva.com/12277/slvs937a-120933-12277974.pdf?src-supplier=Mouser; ComponentLink3URL: https://datasheet.ciiva.com/1947/tps61161a-1947723.pdf?src-supplier=Digikey; ComponentLink3Description: https://datasheet.ciiva.com/1947/tps61161a-1947723.pdf?src-supplier=Digikey; ComponentLink4URL: https://datasheet.ciiva.com/1947/tps61161a-1947724.pdf?src-supplier=Digikey; ComponentLink4Description: https://datasheet.ciiva.com/1947/tps61161a-1947724.pdf?src-supplier=Digikey; ComponentLink5URL: https://datasheet.ciiva.com/1947/tps61161a-1947725.pdf?src-supplier=Digikey; ComponentLink5Description: https://datasheet.ciiva.com/1947/tps61161a-1947725.pdf?src-supplier=Digikey; ComponentLink6URL: https://datasheet.ciiva.com/3165/tps61161a-3165623.pdf?src-supplier=Avnet; ComponentLink6Description: https://datasheet.ciiva.com/3165/tps61161a-3165623.pdf?src-supplier=Avnet

## Sheet HDMI2.0_SHEET.SchDoc
size A4; SheetNumber: 7; SheetTotal: 10
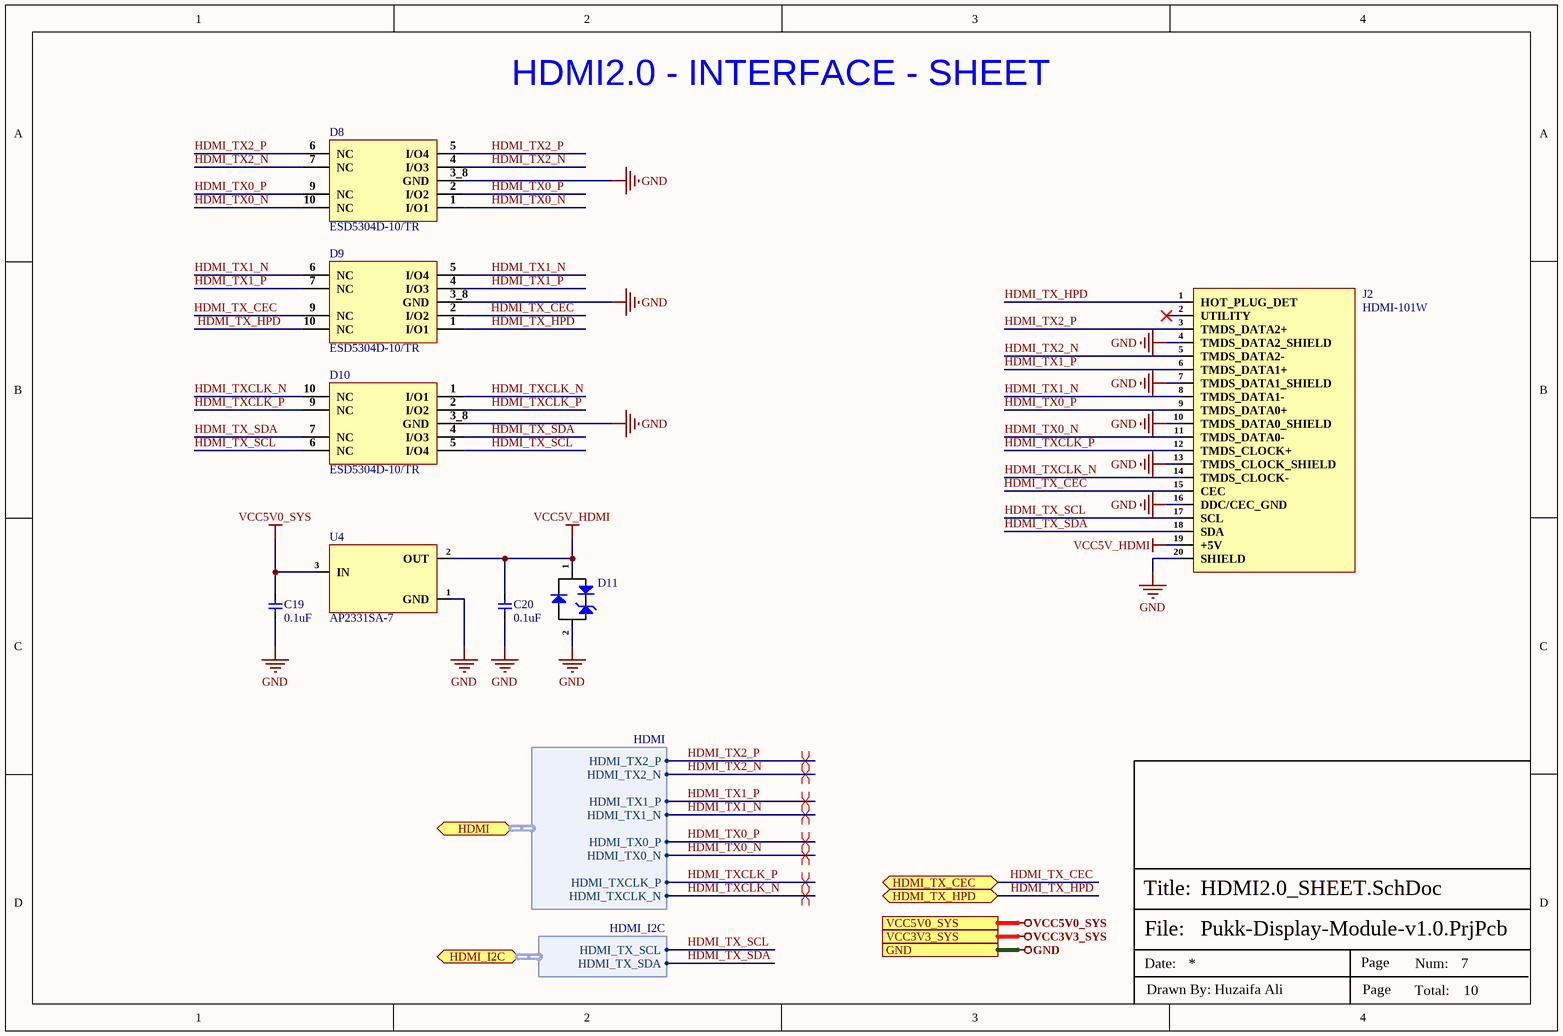
[diagram p6: HDMI2.0_SHEET.SchDoc]

### Parts
C19  0.1uF  [Cap-0402]
C20  0.1uF  [Cap-0402]
D8  ESD5304D-10/TR  [DFN2510-10L_]
D9  ESD5304D-10/TR  [DFN2510-10L_]
D10  ESD5304D-10/TR  [DFN2510-10L_]
D11  ESD5341N-2/TR  [DFN1006-2L_]  (value not drawn)
J2  HDMI-101W  [HDMI-101W]
U4  AP2331SA-7  [SOT-23]

### Ports
GND (see CAN_SHEET[3D], GPS_INTERFACE_SHEET[3D], JOYSTICK_BUTTON_SHEET[3D], MIPI_DISPLAY-SHEET[3D], MISCELLANEOUS_SHEET[3D], POWER_SHEET[3C], radxa_CM3J_SHEET-1[4C], radxa_CM3J_SHEET-2[3D], TYPE-C_INTERFACE_SHEET[3D]), HDMI (bidir, harness HDMI, see radxa_CM3J_SHEET-2[1C]), HDMI_I2C (bidir, harness HDMI_I2C, see radxa_CM3J_SHEET-2[1C]), HDMI_TX_CEC (bidir, see radxa_CM3J_SHEET-2[3D]), HDMI_TX_HPD (bidir, see radxa_CM3J_SHEET-2[3D]), VCC3V3_SYS (see GPS_INTERFACE_SHEET[3D], MIPI_DISPLAY-SHEET[3D], MISCELLANEOUS_SHEET[3D], POWER_SHEET[3C]), VCC5V0_SYS (see CAN_SHEET[3D], MIPI_DISPLAY-SHEET[3D], POWER_SHEET[3C], radxa_CM3J_SHEET-1[4C], TYPE-C_INTERFACE_SHEET[3D])

### Harnesses
HDMI_I2C: HDMI_TX_SCL, HDMI_TX_SDA
HDMI: HDMI_TX2_P, HDMI_TX2_N, HDMI_TX1_P, HDMI_TX1_N, HDMI_TX0_P, HDMI_TX0_N, HDMI_TXCLK_P, HDMI_TXCLK_N

### Nets
GND: C19.1 C20.1 D8.3_8(GND) D9.3_8(GND) D10.3_8(GND) D11.2(A) J2.4(TMDS_DATA2_SHIELD) J2.7(TMDS_DATA1_SHIELD) J2.10(TMDS_DATA0_SHIELD) J2.13(TMDS_CLOCK_SHIELD) J2.16(DDC/CEC_GND) J2.20(SHIELD) U4.1(GND) ; port GND
VCC5V0_SYS: C19.2 U4.3(IN) ; port VCC5V0_SYS
VCC5V_HDMI: C20.2 D11.1(K) J2.19(+5V) U4.2(OUT)
HDMI_TX0_N: D8.1(I/O1) D8.10(NC) J2.11(TMDS_DATA0-) ; port HDMI.HDMI_TX0_N
HDMI_TX0_P: D8.2(I/O2) D8.9(NC) J2.9(TMDS_DATA0+) ; port HDMI.HDMI_TX0_P
HDMI_TX1_N: D9.5(I/O4) D9.6(NC) J2.8(TMDS_DATA1-) ; port HDMI.HDMI_TX1_N
HDMI_TX1_P: D9.4(I/O3) D9.7(NC) J2.6(TMDS_DATA1+) ; port HDMI.HDMI_TX1_P
HDMI_TX2_N: D8.4(I/O3) D8.7(NC) J2.5(TMDS_DATA2-) ; port HDMI.HDMI_TX2_N
HDMI_TX2_P: D8.5(I/O4) D8.6(NC) J2.3(TMDS_DATA2+) ; port HDMI.HDMI_TX2_P
HDMI_TX_CEC: D9.2(I/O2) D9.9(NC) J2.15(CEC) ; port HDMI_TX_CEC
HDMI_TX_HPD: D9.1(I/O1) D9.10(NC) J2.1(HOT_PLUG_DET) ; port HDMI_TX_HPD
HDMI_TX_SCL: D10.5(I/O4) D10.6(NC) J2.17(SCL) ; port HDMI_I2C.HDMI_TX_SCL
HDMI_TX_SDA: D10.4(I/O3) D10.7(NC) J2.18(SDA) ; port HDMI_I2C.HDMI_TX_SDA
HDMI_TXCLK_N: D10.1(I/O1) D10.10(NC) J2.14(TMDS_CLOCK-) ; port HDMI.HDMI_TXCLK_N
HDMI_TXCLK_P: D10.2(I/O2) D10.9(NC) J2.12(TMDS_CLOCK+) ; port HDMI.HDMI_TXCLK_P

Not connected (* = marked no-connect by the designer): J2 2(UTILITY)*

### Layout directives
differential pair; differential pair class HDMI_100R: HDMI_TX0_N, HDMI_TX0_P, HDMI_TX1_N, HDMI_TX1_P, HDMI_TX2_N, HDMI_TX2_P, HDMI_TXCLK_N, HDMI_TXCLK_P

### Notes on the sheet
- HDMI2.0 - INTERFACE - SHEET
- File:
- Title:
- Date:
- Page
- Num:
- Total:
- Drawn By: Huzaifa Ali

### Library data of the parts
C19 C20 = GRM155R71H104ME14D: as C25 on sheet MIPI_DISPLAY-SHEET; Supplier 1: Avnet; Manufacturer Part Number: GRM155R71H104ME14D; RoHS: Yes; Category: Ceramic Capacitors; Stock 1: 100000; Pricing 1: 10000=0.00444, 20000=0.00420, 40000=0.00396, 60000=0.00372, 80000=0.00348, 100000=0.00324, 1000000=0.00300 (USD); Mount: Surface Mount; Case/Package: 0402; Min Operating Temperature: -55°C; Max Operating Temperature: 125°C; Packaging: Cut Tape; Voltage Rating: 50V; Length: 0.039inch; Width: 0.02inch; Thickness: 0.022inch; RoHS Compliant: Yes; ComponentLink1URL: http://www.mouser.com/ds/2/281/c02e-2905.pdf?src-supplier=Mouser; ComponentLink1Description: http://www.mouser.com/ds/2/281/c02e-2905.pdf?src-supplier=Mouser; ComponentLink2URL: http://search.murata.co.jp/Ceramy/image/img/A01X/G101/ENG/GRM155R71H104ME14-01.pdf?src-supplier=Digi-Key; ComponentLink2Description: http://search.murata.co.jp/Ceramy/image/img/A01X/G101/ENG/GRM155R71H104ME14-01.pdf?src-supplier=Digi-Key; ComponentLink3URL: http://psearch.en.murata.com/capacitor/product/GRM155R71H104ME14%23.pdf?src-supplier=Avnet; ComponentLink3Description: http://psearch.en.murata.com/capacitor/product/GRM155R71H104ME14%23.pdf?src-supplier=Avnet; Supplier Part Number 1: GRM155R71H104ME14D; LCSC Part Number: C182412
D8-D10 = ESD5304D-10/TR: 4A@8/20us 12V 7V 5V Unidirectional DFN2510-10L TVS ROHS; Manufacturer: WILLSEMI; Item Type: Diode; Package: DFN2510-10L; LCSC Part Number: C153722; Manufacturer Part Number: ESD5304D-10/TR; ComponentLink1Description: LCSC; ComponentLink1URL: https://www.lcsc.com/product-detail/TVS_WILLSEMI-Will-Semicon-ESD5304D-10-TR_C153722.html
D11 = ESD5341N-2/TR: as D6 on sheet TYPE-C_INTERFACE_SHEET; Manufacturer Part Number: ESD5341N-2/TR; Package: DFN1006-2L; ComponentLink1Description: LCSC; ComponentLink1URL: https://www.lcsc.com/product-detail/TVS_WILLSEMI-Will-Semicon-ESD5341N-2-TR_C239773.html; LCSC Part Number: C239773
J2 = HDMI-101W: SMD HDMI Connectors ROHS; Manufacturer: XUNPU; Manufacturer Part Number: HDMI-101W; Package: SMD; LCSC Part Number: C720619; Item Type: Connector; ComponentLink1Description: LCSC; ComponentLink1URL: https://www.lcsc.com/product-detail/HDMI-Connectors_XUNPU-HDMI-101W_C720619.html
U4 = AP2331SA-7: IC CURRENT SWITCH SOT23-3; Manufacturer: Diodes; Supplier: Digikey; Supplier Part Number: AP2331SA-7DICT-ND; Manufacturer Part Number: AP2331SA-7; RoHS: Yes; Category: Hot Swap Controllers; Stock: 19607; Pricing: 1=0.45, 10=0.383, 25=0.3572, 100=0.2859, 250=0.26548, 500=0.22464, 1000=0.17359 (USD); ComponentLink1URL: https://datasheet.ciiva.com/15108/getdatasheetpartid-670771-15108880.pdf?src-supplier=Verical; ComponentLink1Description: https://datasheet.ciiva.com/15108/getdatasheetpartid-670771-15108880.pdf?src-supplier=Verical; ComponentLink2URL: https://datasheet.ciiva.com/4923/ap2331-6844-4923636.pdf?src-supplier=Mouser; ComponentLink2Description: https://datasheet.ciiva.com/4923/ap2331-6844-4923636.pdf?src-supplier=Mouser; ComponentLink3URL: https://datasheet.ciiva.com/8142/ap2331-8142774.pdf?src-supplier=Avnet; ComponentLink3Description: https://datasheet.ciiva.com/8142/ap2331-8142774.pdf?src-supplier=Avnet; ComponentLink4URL: https://datasheet.ciiva.com/1962/ap2331-1962167.pdf?src-supplier=Digikey; ComponentLink4Description: https://datasheet.ciiva.com/1962/ap2331-1962167.pdf?src-supplier=Digikey; ComponentLink5URL: https://datasheet.ciiva.com/1962/ap2331-1962168.pdf?src-supplier=Digikey; ComponentLink5Description: https://datasheet.ciiva.com/1962/ap2331-1962168.pdf?src-supplier=Digikey; ComponentLink6URL: https://datasheet.ciiva.com/1962/ap2331-1962169.pdf?src-supplier=Digikey; ComponentLink6Description: https://datasheet.ciiva.com/1962/ap2331-1962169.pdf?src-supplier=Digikey; LCSC Part Number: C500764; Item Type: IC